# Altium schematic sheet Amplifier.SchDoc
size A4; SheetNumber: 2; SheetTotal: 2
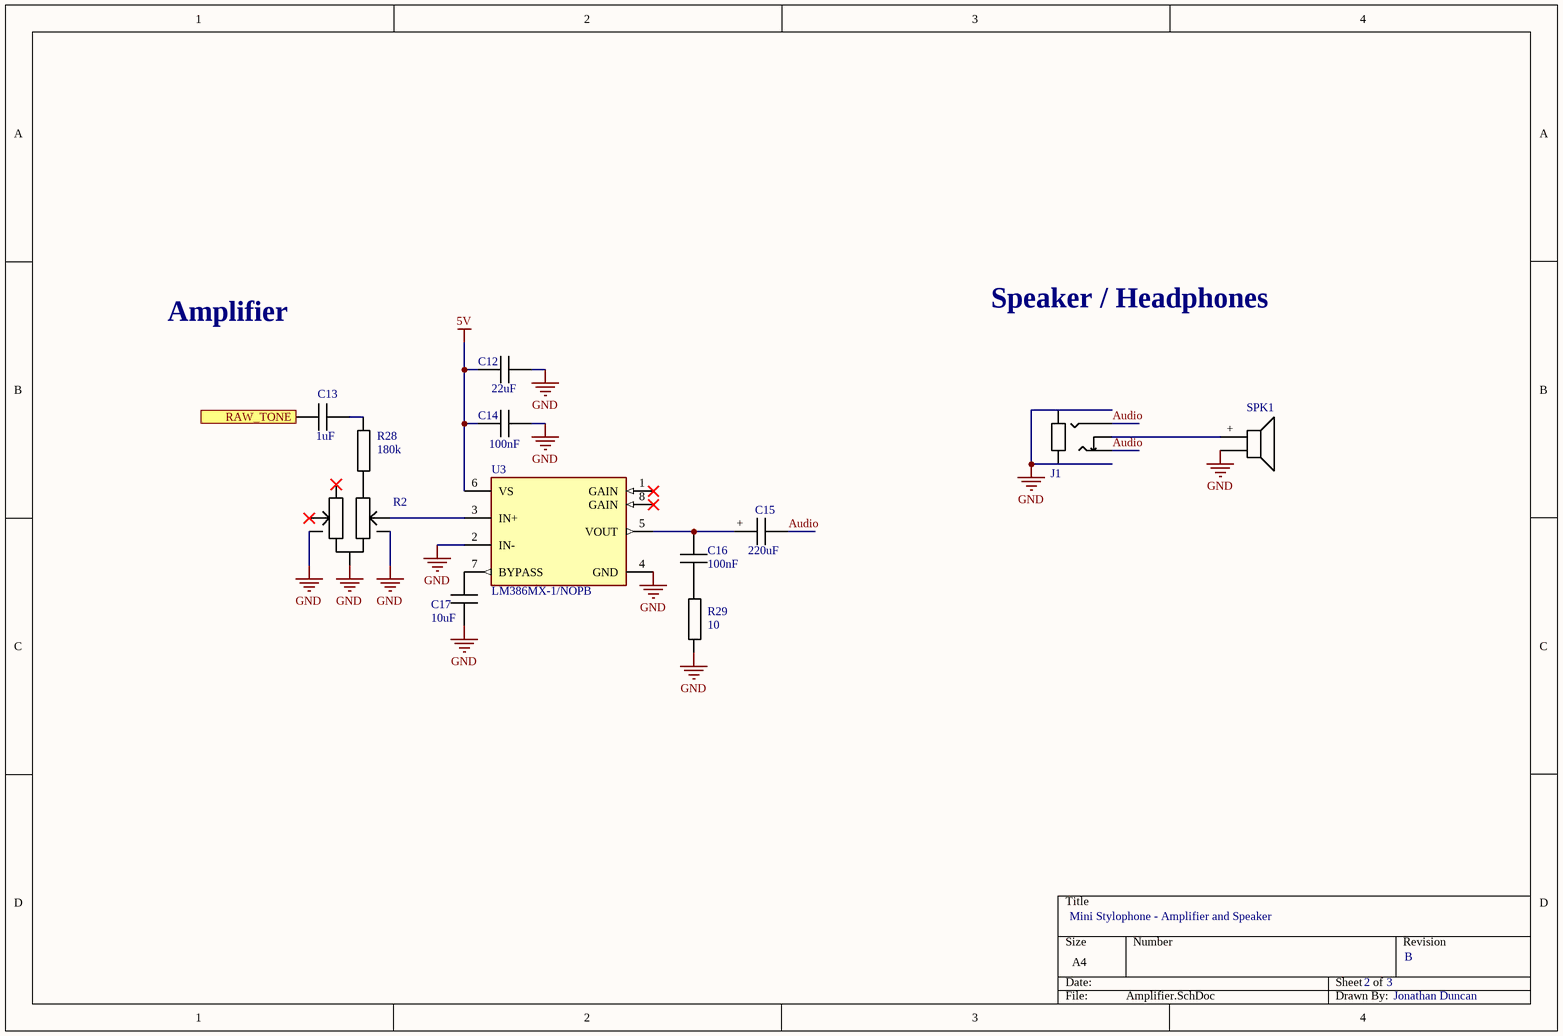
[diagram p0: Amplifier.SchDoc]

## Parts
C12  value 22uF  [FP-CC0603-DA-IPC_B]  (hidden comment: Cap 22uF 0603)
C13  value 1uF  [FP-CC0603-DA-IPC_B]  (hidden comment: Cap 1uF 0603)
C14  value 100nF  [FP-CC0603-DA-IPC_B]  (hidden comment: Cap 100nF 0603)
C15  value 220uF  [VT1C221M0607-Footprint-1]  (hidden comment: VT1C221M0607)
C16  value 100nF  [FP-CC0603-DA-IPC_B]  (hidden comment: Cap 100nF 0603)
C17  value 10uF  [FP-CC0603-DA-IPC_B]  (hidden comment: Cap 10uF 0603)
J1  PJ-327A 5JJ  [PJ-327A 5JJ-Footprint-1]  (value not drawn)
R2  RK10J12R0A0B  [RK10J12R0A0B-Footprint-1]  (value not drawn)
R28  value 180k  [FP-RC0603-0_55-IPC_B]  (hidden comment: Res 180k 0603)
R29  value 10  [FP-RC0603-0_55-IPC_B]  (hidden comment: Res 10R 0603)
SPK1  GSPK2307P-8R1W  [GSPK2307P-8R1W-Footprint-1]  (value not drawn)
U3  LM386MX-1/NOPB  [FP-D0008A-IPC_B]

## Ports
RAW_TONE (in, see ToneGenerator[2B])

## Nets
5V: C12.1 C14.1 U3.6(VS)
GND: C12.2 C14.2 C17.1 J1.1 J1.2 R2.1 R2.6 R2.7 R29.1 SPK1.- U3.2(IN-) U3.4(GND)
Audio: C15.- J1.3 J1.4
RAW_TONE: C13.1 ; port RAW_TONE
NetC13_2: C13.2 R28.2
NetC15_+: C15.+ C16.1 U3.5(VOUT)
NetC16_2: C16.2 R29.2
NetC17_2: C17.2 U3.7(BYPASS)
NetJ1_5: J1.5 SPK1.+
NetR2_4: R2.4 U3.3(IN+)
NetR2_5: R2.5 R28.1

Not connected (* = marked no-connect by the designer): R2 2* 3*; U3 1(GAIN)* 8(GAIN)*

## Notes on the sheet
- Speaker / Headphones
- Amplifier
- Mini Stylophone - Amplifier and Speaker
- 2
- 3
- B
- Jonathan Duncan

## Library data of the parts
C12 = CMP-001-00003-1: 22uF 6.3V 20% X5R 0603 SMD Capacitor; Case/Package: 0603; Mounting Technology: SMT; Voltage Rating: 6.3V; Tolerance: 20%; Temperature Coefficient: X5R
C13 = CMP-001-00001-2: 1uF 25V 10% X5R 0603 SMD Capacitor; Temperature Coefficient: X5R; Case/Package: 0603; Voltage Rating: 25V; Tolerance: 10%; Mounting Technology: SMT
C14 C16 = CMP-00006-5: 100nF 50V 10% X7R 0603 SMD Capacitor Decoupling; Temperature Coefficient: X7R; Mounting Technology: SMT; Tolerance: 10%; Case/Package: 0603; Voltage Rating: 50V
C15 = CMP-00005-2: SMD Aluminum Electrolytic Capacitor SMD, D6.3xL7.7mm 220µF ±20% 16V 2000Hrs@105℃ 110mA@120Hz; Height: 7.7mm; Mounting Technology: SMT; Diameter: 6.3mm; Voltage Rating: 16V; Tolerance: 20%
C17 = CMP-001-00002-1: 10uF 6.3V 10% X5R 0603 SMD Capacitor; Mounting Technology: SMT; Voltage Rating: 6.3V; Case/Package: 0603; Tolerance: 10%; Temperature Coefficient: X5R
J1 = CMP-00021-1: -30℃~+70℃ 3.5mm Headphone Jack 30V 500mA SMD Audio Connectors (Headphones) ROHS
R2 = CMP-00023-1: ±30% 10kΩ SMD-5P, 14x2.5mm Potentiometers, Variable Resistors ROHS
R28 = CMP-009-00001-1: 180k 1% 100mW 0603 SMD Resistor; Mounting Technology: SMT; Power Rating: 100mW; Case/Package: 0603; Tolerance: 1%
R29 = CMP-009-00002-1: 10R 1% 100mW 0603 SMD Resistor; Tolerance: 1%; Case/Package: 0603; Power Rating: 100mW; Mounting Technology: SMT
SPK1 = CMP-00000-7: 5% 8R Electromagnetic Speaker 1.7kHz 88dB 500mW 23mm; Impedance: 8R; Diameter: 23mm; Mounting Technology: THT; Power Rating: 500mW
U3 = CMP-00004-1: 700-mW, mono, 5- to 18-V, analog input Class-AB audio amplifier 8-SOIC 0 to 70; Max Supply Voltage: 12V; Min Supply Voltage: 4V; Case/Package: SOIC; Pins: 8; Mounting Technology: SMT